# EAGLE design TLC._V_1_1_1 (EAGLE 9.6.2)
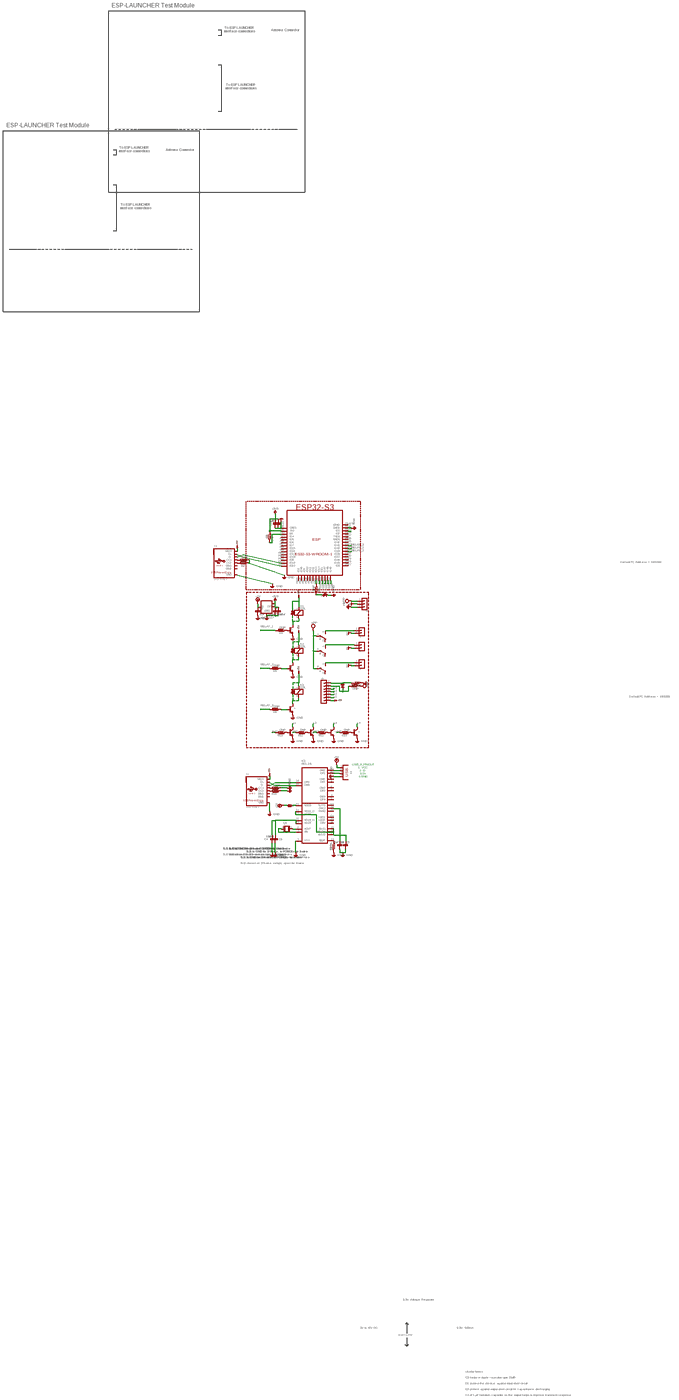
[diagram p0: schematic, sheet 1, overview]
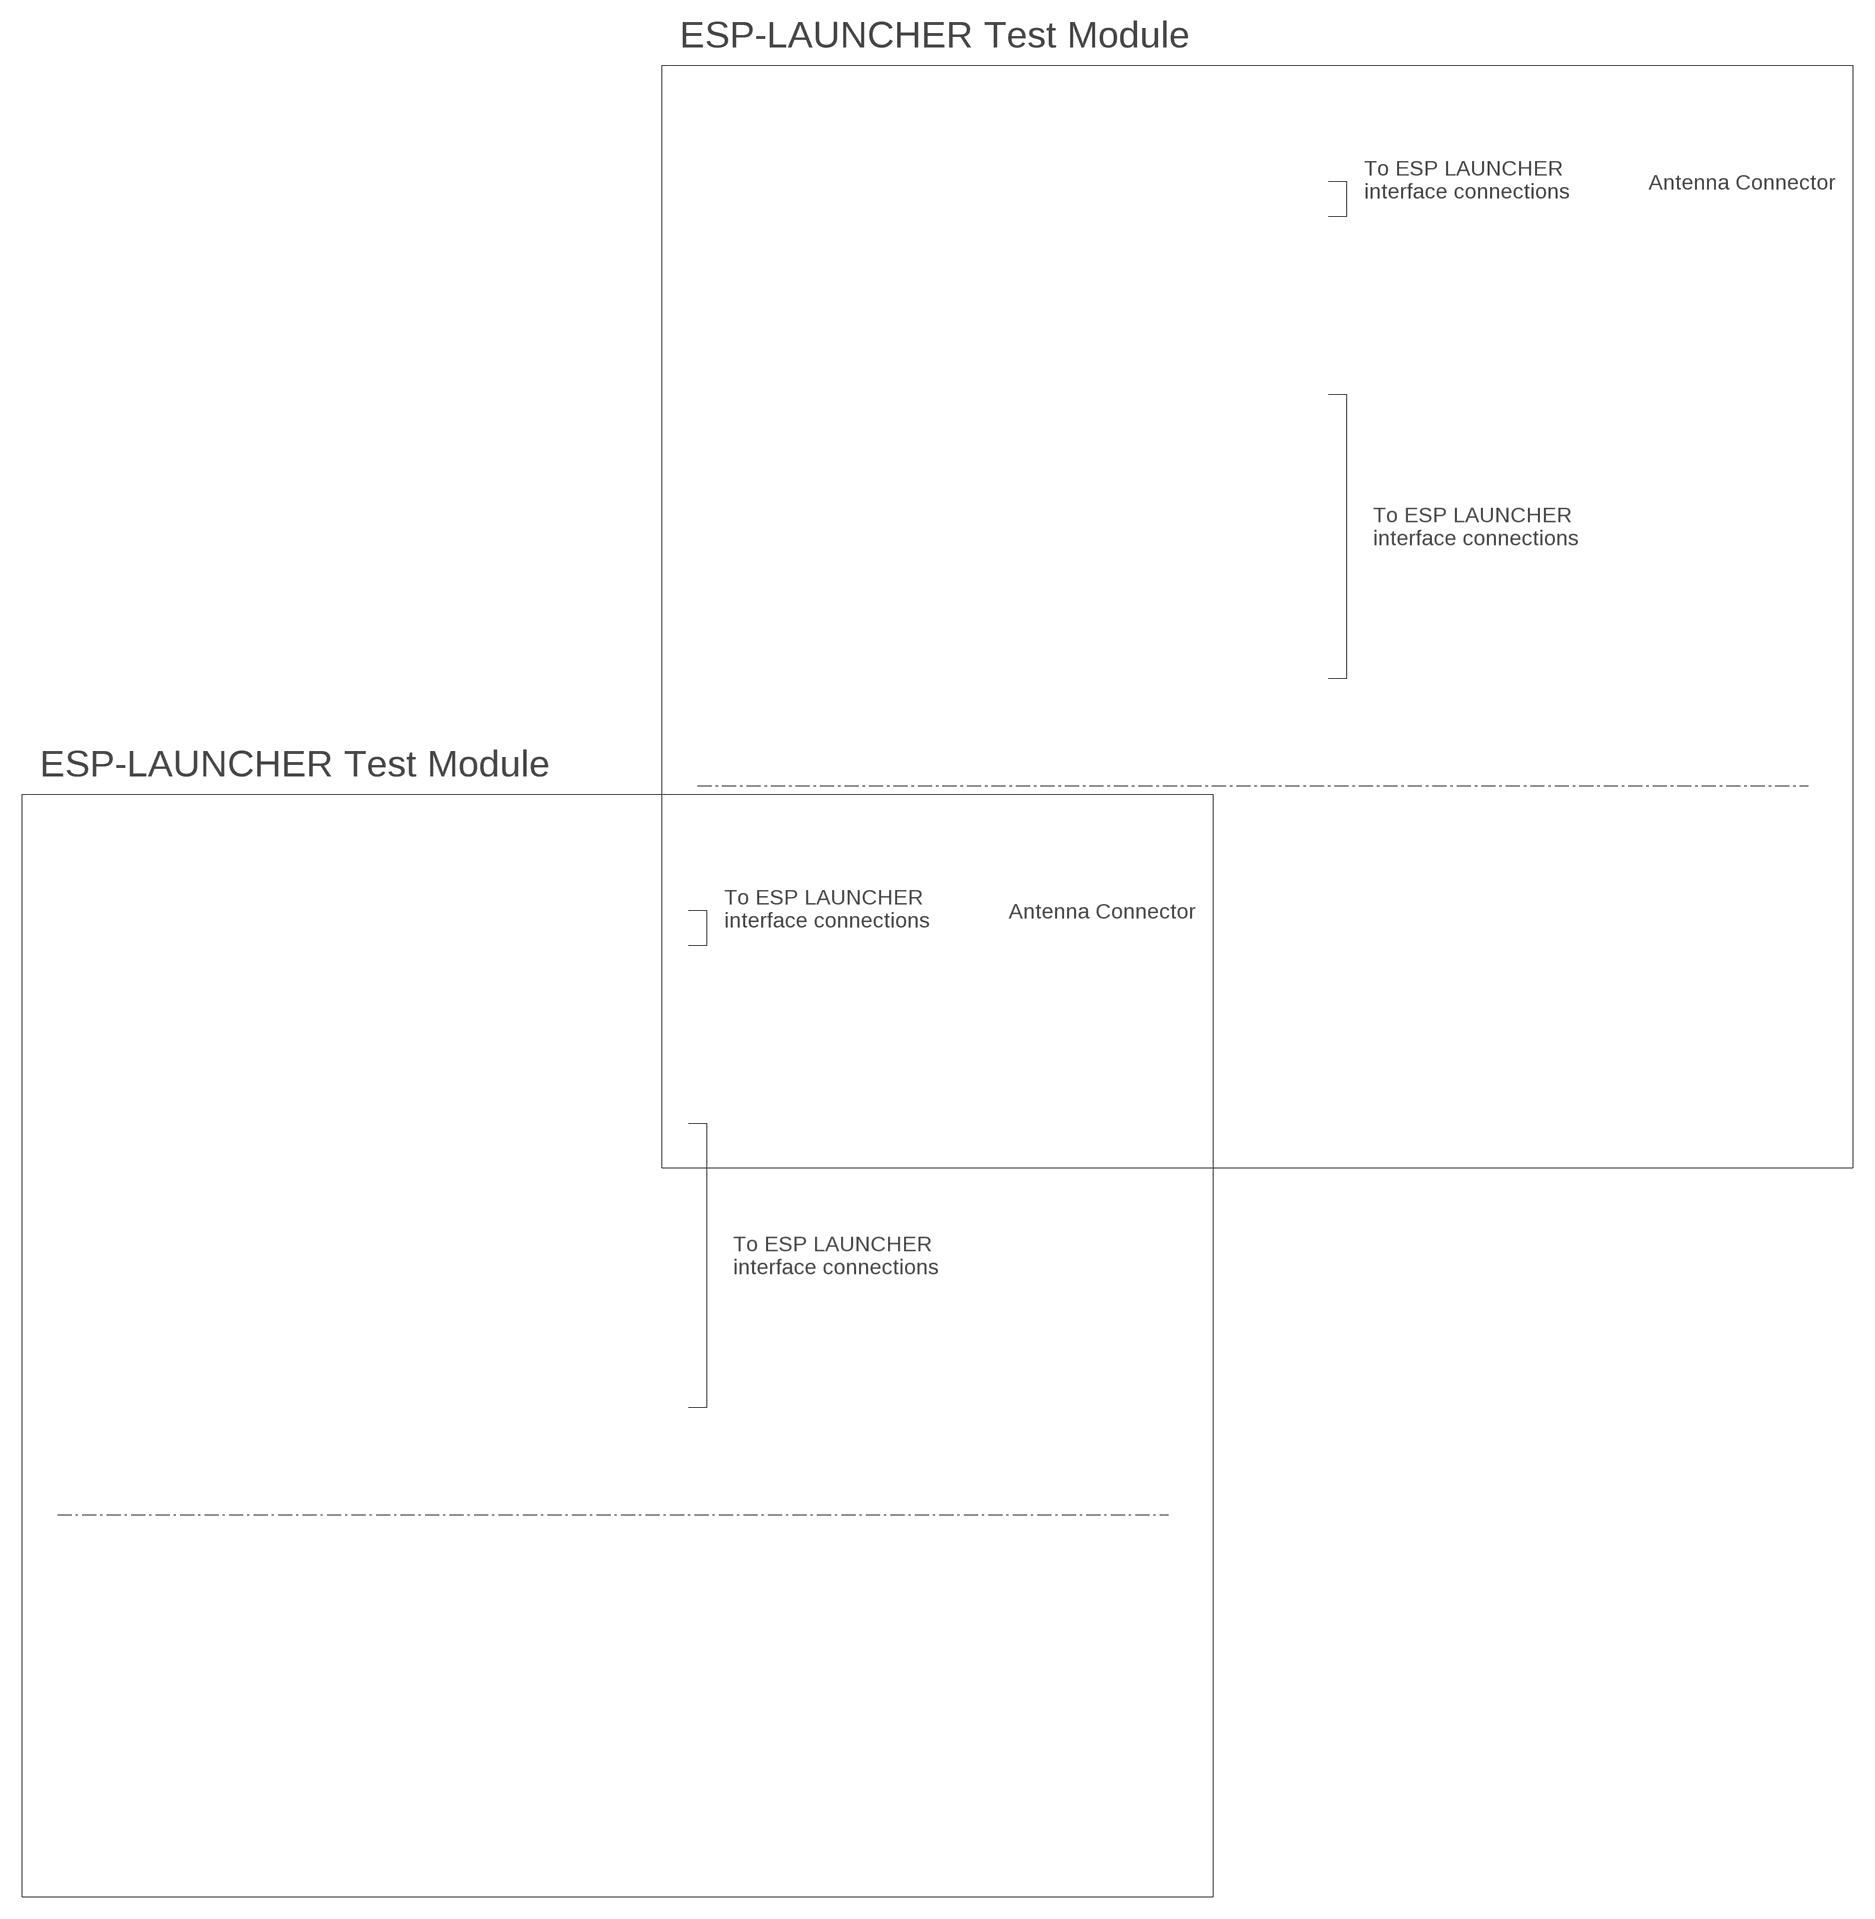
[diagram p1: schematic, sheet 1, part 1 of 4]
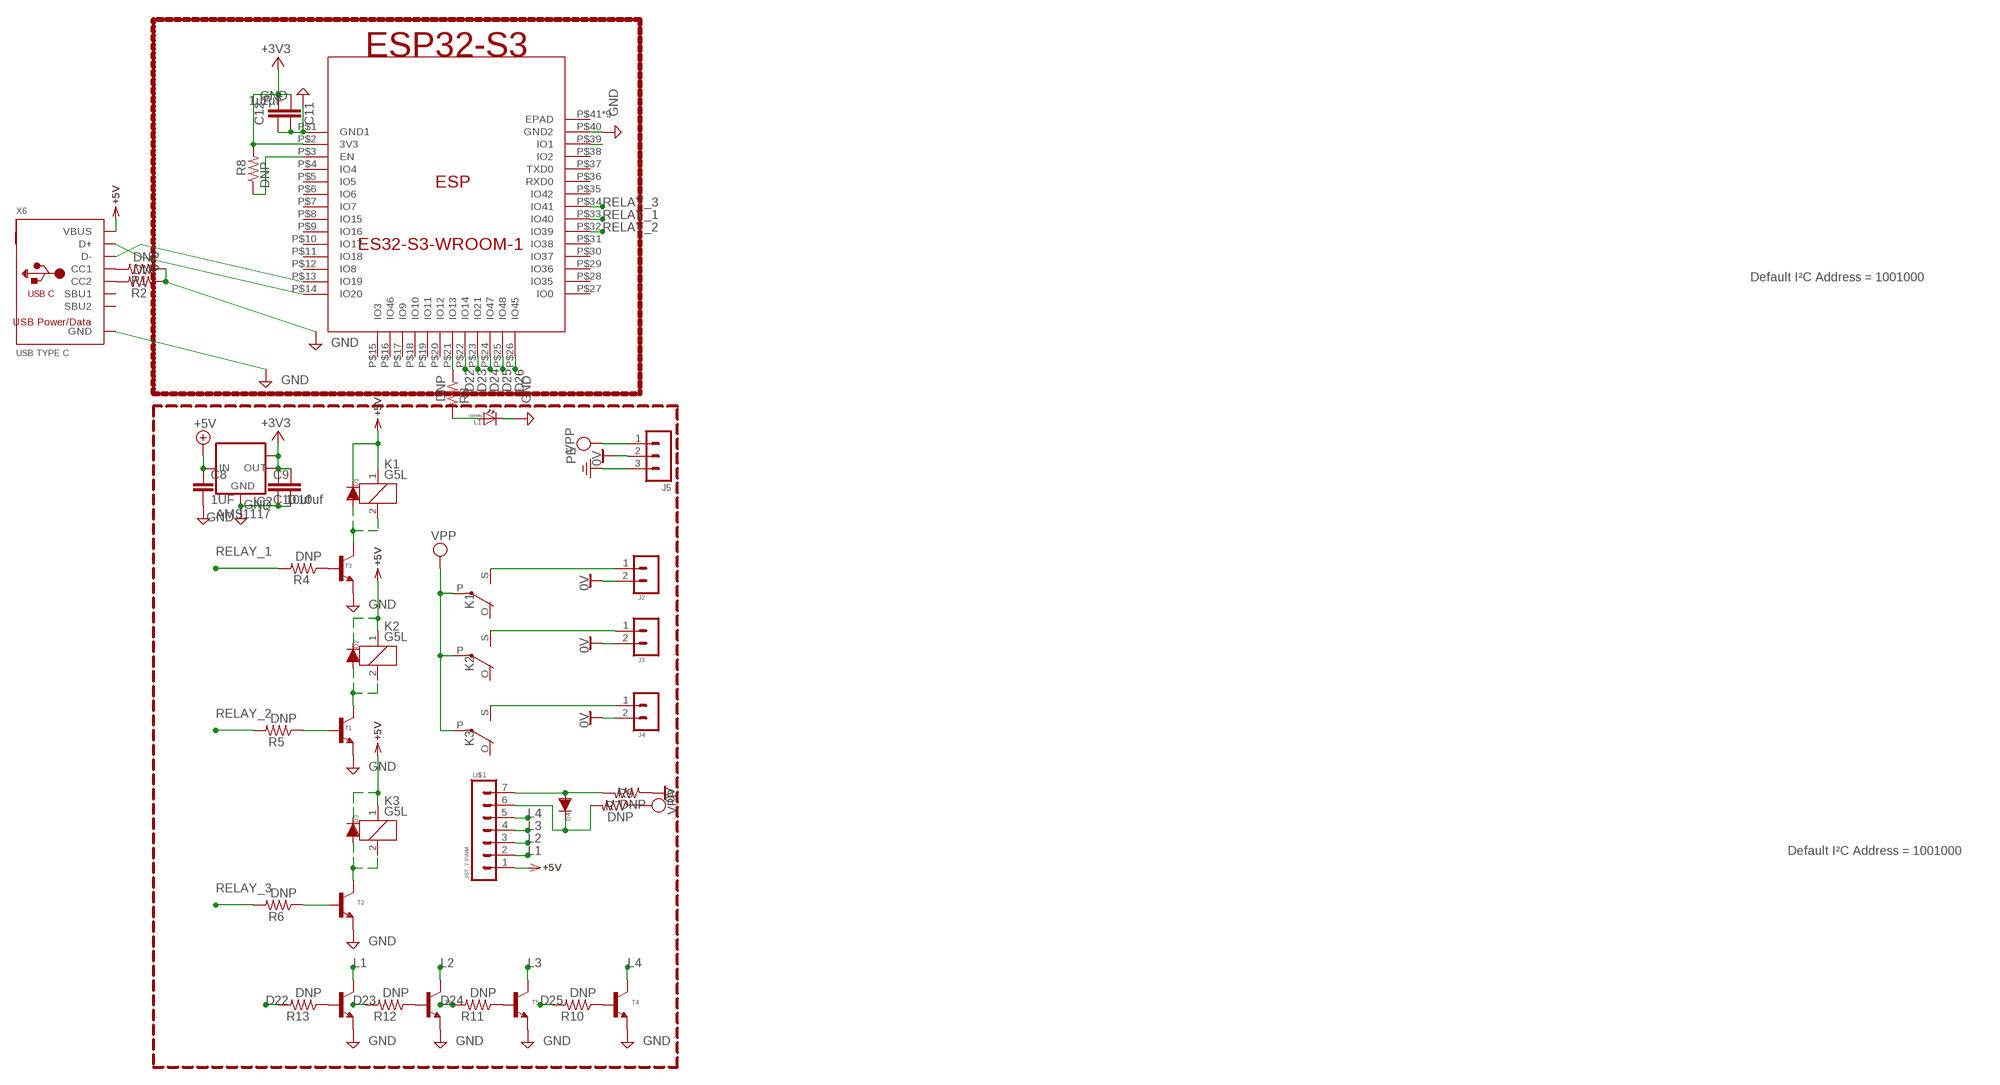
[diagram p2: schematic, sheet 1, part 2 of 4]
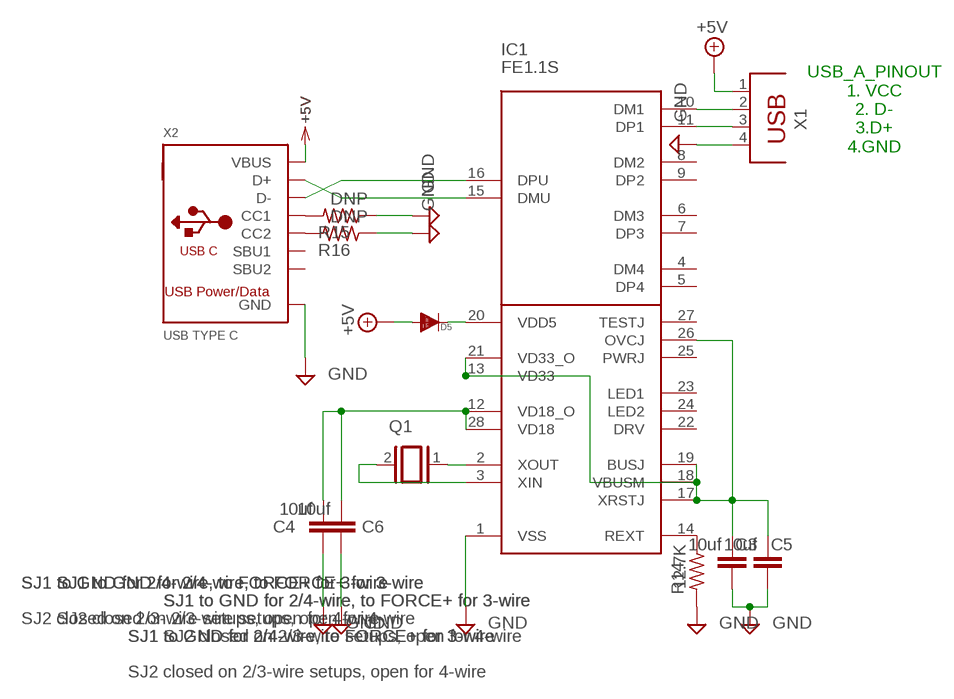
[diagram p3: schematic, sheet 1, part 3 of 4]
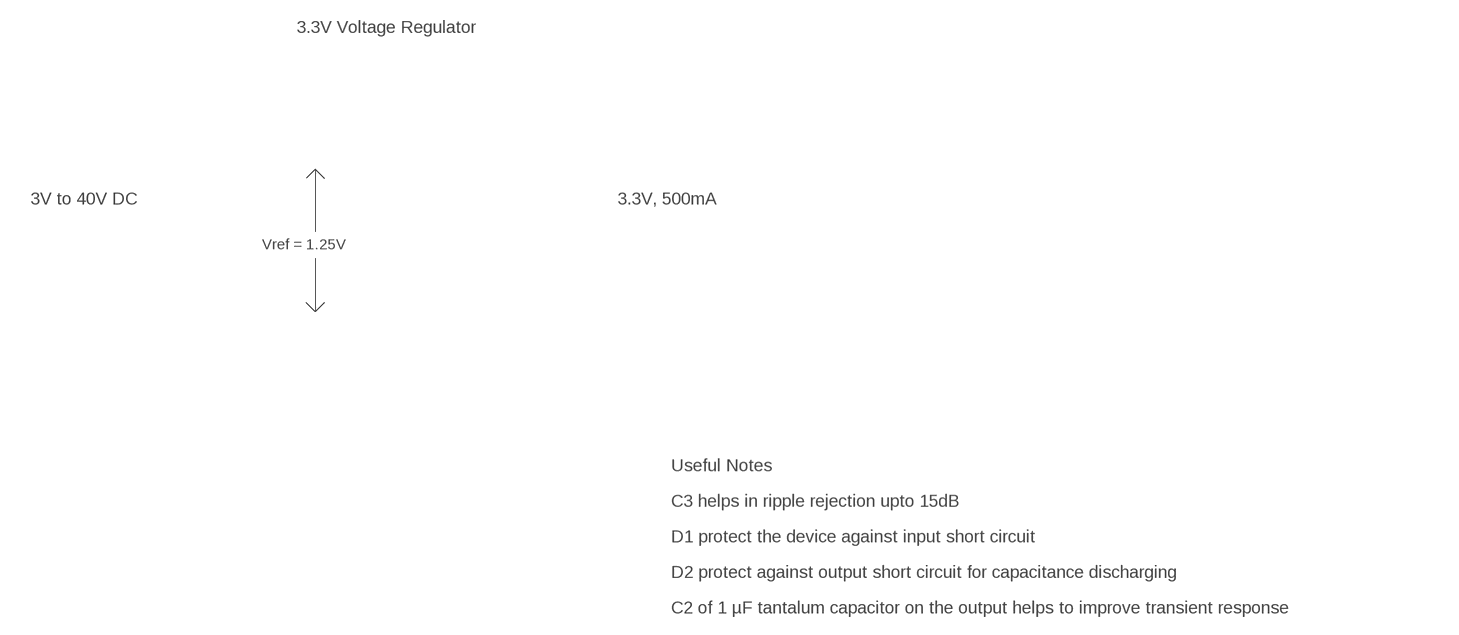
[diagram p4: schematic, sheet 1, part 4 of 4]

## Parts
C3  10uf  C-EUC1206K  [C1206K]
C4  10uf  C-EUC1206K  [C1206K]
C5  10uf  C-EUC1206K  [C1206K]
C6  10uf  C-EUC1206K  [C1206K]
C8  1UF  C-EUC1206K  [C1206K]
C9  10uf  C-EUC1206K  [C1206K]
C10  10uf  C-EUC1206K  [C1206K]
C11  1µF  C-EUC0805K  [C0805K]
C12  1µF  C-EUC0805K  [C0805K]
D1  DIODE80  [SOD-80]
D2  DIODE80  [SOD-80]
D3  DIODE80  [SOD-80]
D4  DIODE80  [SOD-80]
D5  DIODE80  [SOD-80]
ESP  ES32-S3-WROOM-1  [ESP32-S3-WROOM-1]
IC1  FE1.1S  [SOP64P600X175-28N]
IC2  AMS1117  LM1117MPX-5.0  [SOT223]
J2  JST_2-PIN_1.27MMBPT_3.5MM  [BPT-2_PIN_3.5MM]
J3  JST_2-PIN_1.27MMBPT_3.5MM  [BPT-2_PIN_3.5MM]
J4  JST_2-PIN_1.27MMBPT_3.5MM  [BPT-2_PIN_3.5MM]
J5  JST_3-PINPWR_3  [3-PIN_3.96_PWR]
K1  G5L  [G5LE]
K2  G5L  [G5LE]
K3  G5L  [G5LE]
L1  LED5MM  [LED_5MM]
Q1  XTAL/S  [QS]
R1  DNP  R-US_R0603  [R0603]
R2  DNP  R-US_R0603  [R0603]
R3  DNP  R-US_R0603  [R0603]
R4  DNP  R-US_R0603  [R0603]
R5  DNP  R-US_R0603  [R0603]
R6  DNP  R-US_R1206  [R1206]
R7  DNP  R-US_R0603  [R0603]
R8  DNP  R-US_R0603  [R0603]
R9  DNP  R-US_R0603  [R0603]
R10  DNP  R-US_R0603  [R0603]
R11  DNP  R-US_R0603  [R0603]
R12  DNP  R-US_R0603  [R0603]
R13  DNP  R-US_R0603  [R0603]
R14  12.7K  R-US_R0603  [R0603]
R15  DNP  R-US_R0603  [R0603]
R16  DNP  R-US_R0603  [R0603]
T1  TRANSISTOR_NPNSOT-23  [SOT-23]
T2  TRANSISTOR_NPNSOT-23  [SOT-23]
T3  TRANSISTOR_NPNSOT-23  [SOT-23]
T4  TRANSISTOR_NPNSOT-23  [SOT-23]
T5  TRANSISTOR_NPNSOT-23  [SOT-23]
T6  TRANSISTOR_NPNSOT-23  [SOT-23]
T7  TRANSISTOR_NPNSOT-23  [SOT-23]
U$1  JST_7-PINM  [MOLEX_7-PIN]
X1  PN87520  [PN87520]
X2  USB TYPE C  USB_C  [USB_C_CUSB31-CFM2AX-01-X]
X6  USB TYPE C  USB_C  [USB_C_CUSB31-CFM2AX-01-X]

## Nets
0V: J2.2 J3.2 J4.2 J5.2 R9.1
+3V3: C9.1 C10.1 C11.2 C12.2 ESP.P$2(3V3) IC2.2(OUT) IC2.TAB(OUT1) R8.2
+5V: C8.1 D1.K D2.K D3.K D5.A IC2.3(IN) K1.1 K2.1 K3.1 U$1.1 X1.1 X2.A4B9(VBUS) X2.B4A9(VBUS) X6.A4B9(VBUS) X6.B4A9(VBUS)
D22: ESP.P$22(IO14) R13.2
D23: ESP.P$23(IO21) R12.2
D24: ESP.P$24(IO47) R11.2
D25: ESP.P$25(IO48) R10.2
D26: ESP.P$26(IO45)
GND: C3.1 C4.1 C5.1 C6.1 C8.2 C9.2 C10.2 C11.1 C12.1 ESP.P$1(GND1) ESP.P$40(GND2) IC1.1(VSS) IC2.1(GND) L1.K R1.1 R2.1 R14.2 R15.1 R16.1 T1.2(E) T2.2(E) T3.2(E) T4.2(E) T5.2(E) T6.2(E) T7.2(E) X1.4 X2.A1B12(GND) X2.B1A12(GND) X6.A1B12(GND) X6.B1A12(GND)
L1: T7.3(C) U$1.2
L2: T6.3(C) U$1.3
L3: T5.3(C) U$1.4
L4: T4.3(C) U$1.5
N$1: R1.2 X6.A5(CC1)
N$2: R2.2 X6.B5(CC2)
N$3: ESP.P$39(IO1)
N$4: ESP.P$21(IO13) R3.1
N$5: L1.A R3.2
N$6: R5.1 T1.1(B)
N$7: D4.K R7.2 U$1.6
N$8: R4.1 T3.1(B)
N$9: J4.1 K3.S(2:S)
N$10: D1.A K1.2 T3.3(C)
N$11: D4.A R9.2 U$1.7
N$12: D2.A K2.2 T1.3(C)
N$13: R10.1 T4.1(B)
N$14: R6.1 T2.1(B)
N$15: ESP.P$3(EN) R8.1
N$16: ESP.P$13(IO19) X6.A7(D-) X6.B7(D-)
N$17: ESP.P$14(IO20) X6.A6(D+) X6.B6(D+)
N$18: D3.A K3.2 T2.3(C)
N$19: J3.1 K2.S(2:S)
N$20: J2.1 K1.S(2:S)
N$21: IC1.2(XOUT) Q1.1
N$22: R11.1 T5.1(B)
N$23: IC1.3(XIN) Q1.2
N$24: R12.1 T6.1(B)
N$25: IC1.14(REXT) R14.1
N$26: R13.1 T7.1(B)
N$27: D5.K IC1.20(VDD5)
N$28: C3.2 C5.2 IC1.13(VD33) IC1.17(XRSTJ) IC1.18(VBUSM) IC1.19(BUSJ) IC1.21(VD33_O) IC1.26(OVCJ)
N$29: IC1.10(DM1) X1.2
N$30: C4.2 C6.2 IC1.12(VD18_O) IC1.28(VD18)
N$31: IC1.11(DP1) X1.3
N$32: IC1.16(DPU) X2.A7(D-) X2.B7(D-)
N$33: IC1.15(DMU) X2.A6(D+) X2.B6(D+)
N$34: R15.2 X2.A5(CC1)
N$35: R16.2 X2.B5(CC2)
PE: J5.3
RELAY_1: ESP.P$33(IO40) R4.2
RELAY_2: ESP.P$32(IO39) R5.2
RELAY_3: ESP.P$34(IO41) R6.2
VPP: J5.1 K1.P(2:P) K2.P(2:P) K3.P(2:P) R7.1
Unconnected: ESP.P$4(IO4) ESP.P$5(IO5) ESP.P$6(IO6) ESP.P$7(IO7) ESP.P$8(IO15) ESP.P$9(IO16) ESP.P$10(IO17) ESP.P$11(IO18) ESP.P$12(IO8) ESP.P$15(IO3) ESP.P$16(IO46) ESP.P$17(IO9) ESP.P$18(IO10) ESP.P$19(IO11) ESP.P$20(IO12) ESP.P$27(IO0) ESP.P$28(IO35) ESP.P$29(IO36) ESP.P$30(IO37) ESP.P$31(IO38) ESP.P$35(IO42) ESP.P$36(RXD0) ESP.P$37(TXD0) ESP.P$38(IO2) ESP.P$41(EPAD) ESP.P$42(EPAD) ESP.P$43(EPAD) ESP.P$44(EPAD) ESP.P$45(EPAD) ESP.P$46(EPAD) ESP.P$47(EPAD) ESP.P$48(EPAD) ESP.P$49(EPAD) IC1.4(DM4) IC1.5(DP4) IC1.6(DM3) IC1.7(DP3) IC1.8(DM2) IC1.9(DP2) IC1.22(DRV) IC1.23(LED1) IC1.24(LED2) IC1.25(PWRJ) IC1.27(TESTJ) K1.O(2:O) K2.O(2:O) K3.O(2:O) X2.A8(SBU1) X2.B8(SBU2) X6.A8(SBU1) X6.B8(SBU2)

## Notes on the sheet
- ESP-LAUNCHER Test Module
- Antenna Connector
- To ESP LAUNCHER
  interface connections
- To ESP LAUNCHER
  interface connections
- ESP-LAUNCHER Test Module
- Antenna Connector
- To ESP LAUNCHER
  interface connections
- To ESP LAUNCHER
  interface connections
- Default I²C Address = 1001000
- USB Power/Data
- Default I²C Address = 1001000
- USB_A_PINOUT
  1. VCC
  2. D-
  3.D+
  4.GND
- USB Power/Data
- SJ1 to GND for 2/4-wire, to FORCE+ for 3-wire | SJ1 to GND for 2/4-wire, to FORCE+ for 3-wire | SJ1 to GND for 2/4-wire, to FORCE+ for 3-wire | SJ1 to GND for 2/4-wire, to FORCE+ for 3-wire
- SJ1 to GND for 2/4-wire, to FORCE+ for 3-wire | SJ1 to GND for 2/4-wire, to FORCE+ for 3-wire
- SJ2 closed on 2/3-wire setups, open for 4-wire | SJ2 closed on 2/3-wire setups, open for 4-wire
- SJ1 to GND for 2/4-wire, to FORCE+ for 3-wire | SJ1 to GND for 2/4-wire, to FORCE+ for 3-wire | SJ2 closed on 2/3-wire setups, open for 4-wire
- SJ2 closed on 2/3-wire setups, open for 4-wire
- 3.3V Voltage Regulator
- 3V to 40V DC | 3.3V, 500mA
- Vref = 1.25V
- Useful Notes
- C3 helps in ripple rejection upto 15dB
- D1 protect the device against input short circuit
- D2 protect against output short circuit for capacitance discharging
- C2 of 1 µF tantalum capacitor on the output helps to improve transient response

## Library data of the parts
C3-C6 C8-C12 = rcl:C-EU: CAPACITOR, European symbol; SPICEPREFIX: C
D1-D5 = Squadron:DIODE
ESP = ESP32 Module:ES32-S3-WROOM-1
IC1 = FE1.1S:FE1.1S: Check availability <https://pricing.snapeda.com/parts/FE1.1S/terminus/view-part?ref=eda>; AVAILABILITY: In Stock; CHECK_PRICES: https://www.snapeda.com/parts/FE1.1S/Terminus/view-part/?ref=eda; DESCRIPTION: USB 2.0 HIGH SPEED 4-PORT HUB CONTROLLER; MF: terminus; MP: FE1.1S; PACKAGE: None; PRICE: None; SNAPEDA_LINK: https://www.snapeda.com/parts/FE1.1S/Terminus/view-part/?ref=snap
IC2 = lm1117:LM1117MPX-*
J2-J4 = Squadron:JST_2-PIN_1.27MM
J5 = Squadron:JST_3-PIN
K1-K3 = relay:G5L: RELAY 1 x switch, 10 A/120 V AC, 8 A/30 V ADC, Omron
L1 = Squadron:LED
Q1 = special:XTAL/S: CRYSTAL
R1-R16 = rcl:R-US_: RESISTOR, American symbol; SPICEPREFIX: R
T1-T7 = Squadron:TRANSISTOR_NPN
U$1 = Squadron:JST_7-PIN
X1 = con-berg:PN87520: BERG USB connector; OC_FARNELL: unknown; OC_NEWARK: unknown
X2 X6 = adafruit_electromech:USB_C: USB Type-C USB 2.0 Connector

## Module WAVESHAREDISPLAY
Ports: 

### Library data of the parts

## Board
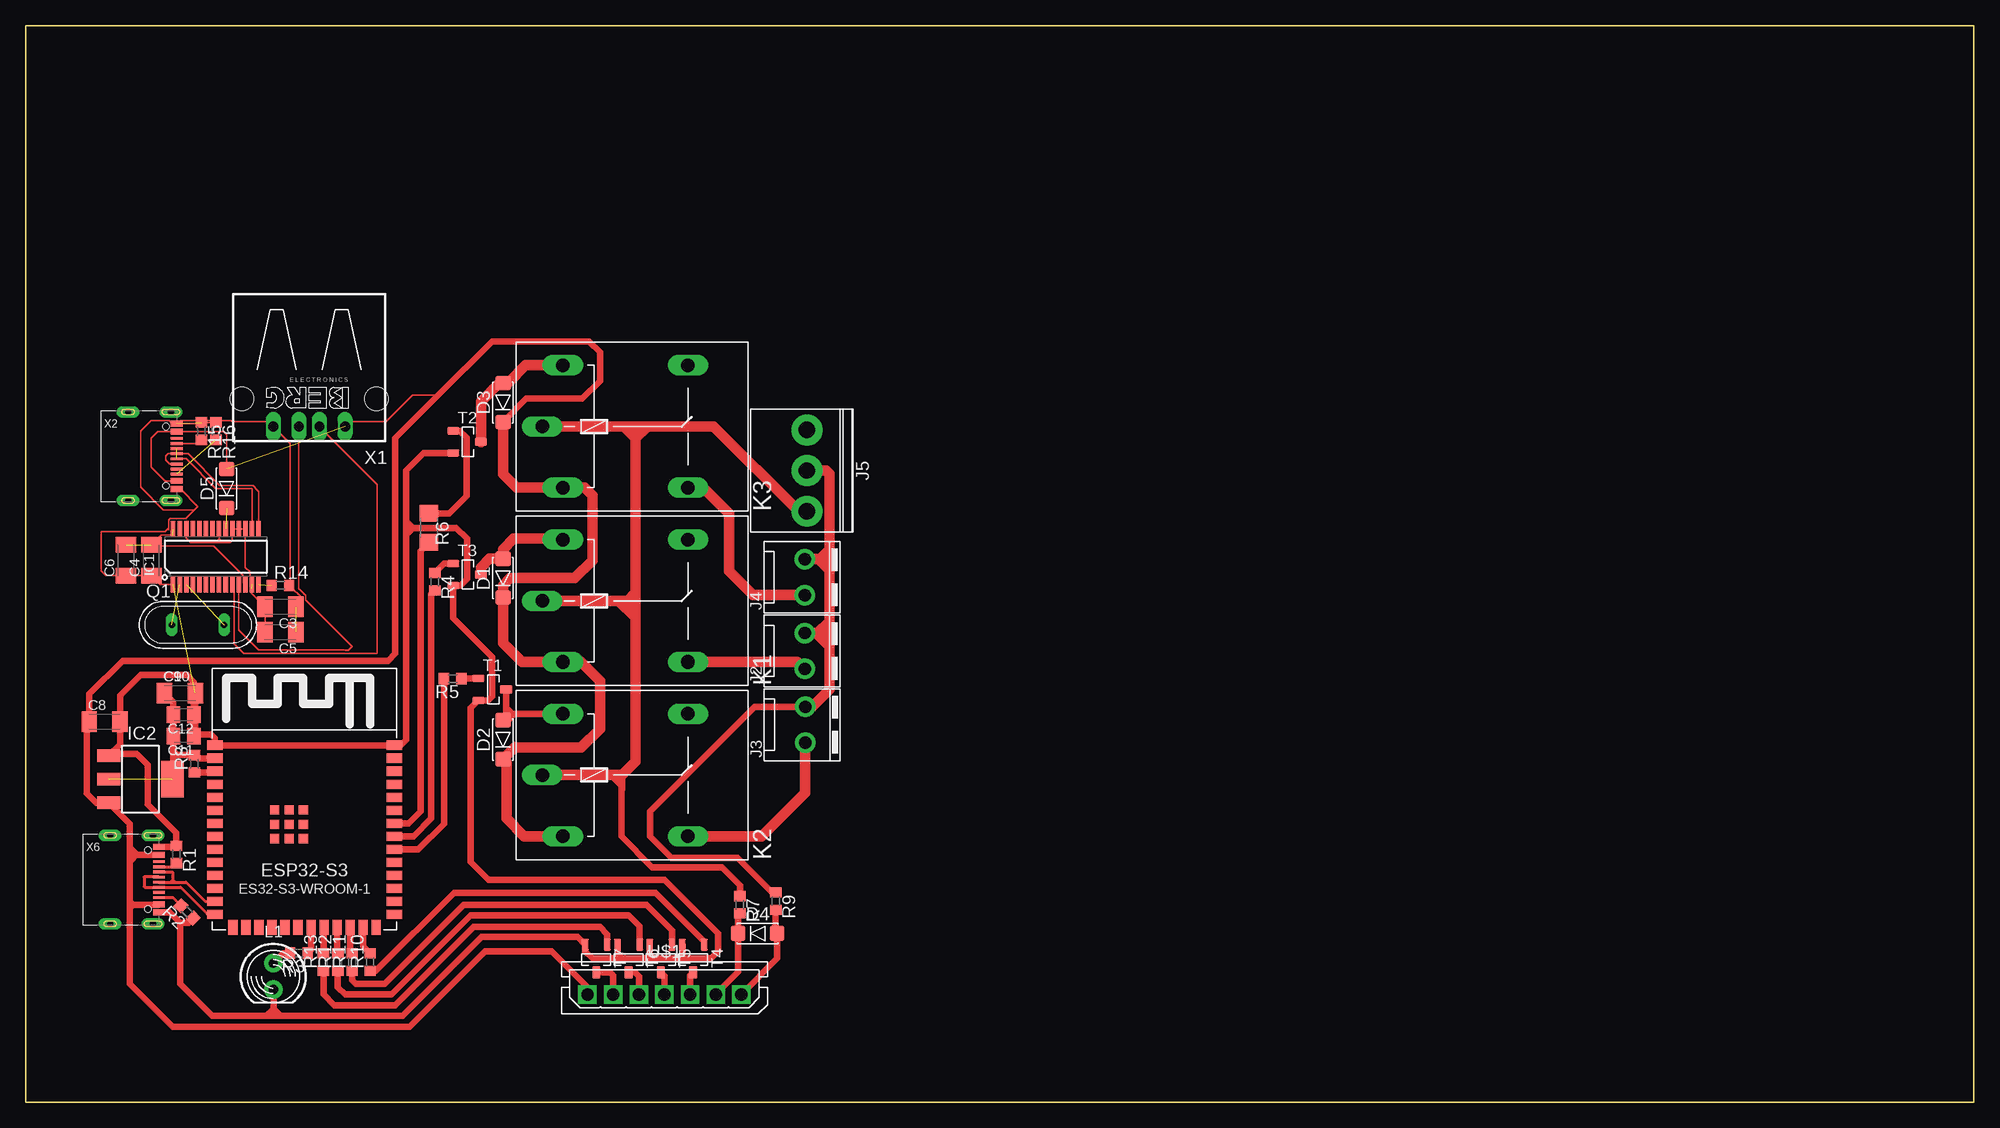
[diagram p5: board, top side]

Size 190 x 105 mm. Coordinates in mm from the lower left corner, seen from the top.
Outline: 0,0 190,0 190,105 0,105 0,0
Copper layers (1*16): Top 0.035mm / dielectric 1.5mm / Bottom 0.035mm
Design rules "default": minimum track width 6mil, minimum drill 0.35mm, track to track 6mil, track to pad 6mil, pad to pad 6mil, via to via 6mil, smd to smd 6mil, copper to edge 40mil, drill to drill 6mil, minimum pad ring 10mil, minimum via ring 8mil, stop-mask expansion 4mil, vias tented up to drill 0mil, thermal gap 10mil

### Footprints (pad centres in the part's own frame; a part is rotated, then mirrored left to right if it is on the bottom)
C1206K = smd 1.5 x 2: 1 -1.5,0; 2 1.5,0
C0805K = smd 1.3 x 1.6: 1 -1,0; 2 1,0
SOD-80 = smd 1.4 x 1.5: A -1.9,0; K 1.9,0
ESP32-S3-WROOM-1 = smd 1.5 x 0.9: P$1 0.25,18.01; P$2 0.25,16.74; P$3 0.25,15.47; P$4 0.25,14.2; P$5 0.25,12.93; P$6 0.25,11.66; P$7 0.25,10.39; P$8 0.25,9.12; P$9 0.25,7.85; P$10 0.25,6.58; P$11 0.25,5.31; P$12 0.25,4.04; P$13 0.25,2.77; P$14 0.25,1.5; P$27 17.75,1.5; P$28 17.75,2.77; P$29 17.75,4.04; P$30 17.75,5.31; P$31 17.75,6.58; P$32 17.75,7.85; P$33 17.75,9.12; P$34 17.75,10.39; P$35 17.75,11.66; P$36 17.75,12.93; P$37 17.75,14.2; P$38 17.75,15.47; P$39 17.75,16.74; P$40 17.75,18.01 | smd 0.9 x 1.5: P$15 2.015,0.25; P$16 3.285,0.25; P$17 4.555,0.25; P$18 5.825,0.25; P$19 7.095,0.25; P$20 8.365,0.25; P$21 9.635,0.25; P$22 10.905,0.25; P$23 12.175,0.25; P$24 13.445,0.25; P$25 14.715,0.25; P$26 15.985,0.25 | smd 0.9 x 0.9: P$41 6.1,11.69; P$42 7.5,11.69; P$43 8.9,11.69; P$44 6.1,10.29; P$45 7.5,10.29; P$46 8.9,10.29; P$47 6.1,8.89; P$48 7.5,8.89; P$49 8.9,8.89
SOP64P600X175-28N = smd 0.44 x 1.525: 1 -4.16,-2.712; 2 -3.52,-2.712; 3 -2.88,-2.712; 4 -2.24,-2.712; 5 -1.6,-2.712; 6 -0.96,-2.712; 7 -0.32,-2.712; 8 0.32,-2.712; 9 0.96,-2.712; 10 1.6,-2.712; 11 2.24,-2.712; 12 2.88,-2.712; 13 3.52,-2.712; 14 4.16,-2.712; 15 4.16,2.712; 16 3.52,2.712; 17 2.88,2.712; 18 2.24,2.712; 19 1.6,2.712; 20 0.96,2.712; 21 0.32,2.712; 22 -0.32,2.712; 23 -0.96,2.712; 24 -1.6,2.712; 25 -2.24,2.712; 26 -2.88,2.712; 27 -3.52,2.712; 28 -4.16,2.712
SOT223 = smd 1.219 x 2.235: 1 -2.311,-3.099; 2 0,-3.099; 3 2.311,-3.099 | smd 3.6 x 2.2: TAB 0,3.099
BPT-2_PIN_3.5MM = drill 1.2 pad 2: 1 -1.75,0; 2 1.75,0
3-PIN_3.96_PWR = drill 1.6 pad 3: 1 3.96,5.5; 2 0,5.5; 3 -3.96,5.5
G5LE = drill 1.321 long: 1 -7.493,-5.969; 2 -7.493,5.969; O 4.699,5.969; P -9.525,0; S 4.699,-5.969
LED_5MM = drill 0.9 pad 1.8: A 0,-1.295; K -0.025,1.27
QS = drill 0.61 long: 1 -2.54,0; 2 2.54,0
R0603 = smd 1 x 1.1: 1 -0.85,0; 2 0.85,0
R1206 = smd 1.6 x 1.803: 1 -1.422,0; 2 1.422,0
SOT-23 = smd 0.7 x 1.2: 1 -1.077,-1.35; 2 1.077,-1.35 | smd 0.8 x 1.2: 3 0,1.35
MOLEX_7-PIN = drill 1.2 pad 1.75 square: 1 7.5,0; 2 5,0; 3 2.5,0; 4 0,0; 5 -2.5,0; 6 -5,0; 7 -7.5,0
PN87520 = drill 0.95 long: 1 -3.5,2.71; 2 -1,2.71; 3 1,2.71; 4 3.5,2.71 | hole 2.3: -6.57,0; 6.57,0
USB_C_CUSB31-CFM2AX-01-X = smd 0.575 x 1.15: A1B12 -3.2,3.545; A4B9 -2.4,3.545; B1A12 3.2,3.545; B4A9 2.4,3.545 | smd 0.275 x 1.15: A5 -1.25,3.545; A6 -0.25,3.545; A7 0.25,3.545; A8 1.25,3.545; B5 1.75,3.545; B6 0.75,3.545; B7 -0.75,3.545; B8 -1.75,3.545 | drill 0.6 pad 1 long: M1 -4.32,2.97; M2 4.32,2.97; M3 -4.32,-1.21; M4 4.32,-1.21 | hole 0.65: 2.89,2.47; -2.89,2.47

### Placement (x,y rotation side)
C3  24.85,48.3 180 top
C4  12.25,52.85 90 top
C5  24.85,45.85 180 top
C6  9.8,52.85 90 top
C8  7.7,37.1 0 top
C9  15.05,39.9 0 top
C10  15.05,39.9 0 top
C11  15.4,35.7 180 top
C12  15.4,37.8 180 top
D1  46.55,51.1 270 top
D2  46.55,35.35 270 top
D3  46.55,68.25 270 top
D4  71.4,16.45 180 top
D5  19.6,59.85 270 top
ESP  18.2,16.8 0 top
IC1  18.55,53.2 0 top
IC2  11.2,31.5 270 top
J2  76,44 90 top
J3  76.03,36.8 90 top
J4  76,51.2 90 top
J5  70.7,61.6 270 top
K1  59.9,48.9 0 top
K2  59.9,31.9 0 top
K3  59.9,65.9 0 top
L1  24.15,12.25 180 top
Q1  16.8,46.55 0 top
R1  14.7,24.15 270 top
R2  15.75,18.55 135 top
R3  26.65,14.53 180 top
R4  39.9,50.75 270 top
R5  41.65,41.3 180 top
R6  39.35,56.02 270 top
R7  69.65,19.25 270 top
R8  16.45,33 90 top
R9  73.15,19.6 270 top
R10  33.6,13.65 90 top
R11  31.85,13.65 90 top
R12  30.45,13.65 90 top
R13  29.05,13.65 90 top
R14  24.85,50.4 0 top
R15  17.15,65.45 270 top
R16  18.55,65.45 270 top
T1  45.5,40.25 270 top
T2  43.05,64.4 270 top
T3  43.05,51.45 270 top
T4  65.1,14 180 top
T5  61.95,14 180 top
T6  58.8,14 180 top
T7  55.65,14 180 top
U$1  62.3,10.5 180 top
X1  27.65,68.6 180 top
X2  11.2,63 270 top
X6  9.45,21.7 270 top

### Tracks (layer width: path | path; a pad name or v marks a point on that pad's centre or on a via)
0V
  Top 0.61: R9.1 72.8,20.45 69.45,23.8 63,23.8 60.9,25.9 60.9,28.35 71.1,38.55 J3.2
  Top 1.016: J3.2 76.7,38.55 78.4,40.25 78.4,44.45 | 77.1,45.75 78.4,44.45 | 77.1,45.75 J2.2 77.95,45.75 78.4,46.2 | 78.4,44.45 78.4,46.2 | 78.4,46.2 78.4,46.9 | 78.4,46.9 78.4,51.9 | 78.4,51.9 78.4,52.5 | 77.45,52.95 77.95,52.95 78.4,52.5 | J4.2 77.35,52.95 | J5.2 78.05,61.6 78.4,61.25 78.4,53.9 | 78.4,53.9 78.4,52.5 | 77.35,52.95 77.45,52.95 | 77.45,52.95 78.4,53.9 | 77.35,52.95 78.4,51.9 | 77.1,45.75 77.25,45.75 78.4,46.9
+3V3  (1 unrouted)
  Top 0.61: IC2.TAB 14.35,31.5 14.7,31.15 14.65,31.15 IC2.TAB | IC2.TAB 14.4,31.6 14.4,34.25 | 14.4,34.25 C11.2 C12.2 14.4,39.05 C10.1 | 14.4,34.25 14.8,33.85 R8.2 16.76,33.54 ESP.P$2
+5V  (1 unrouted)
  Top 0.152: D5.A 19.6,65.1 19.3,65.4 X2.A4B9 12.9,65.4 12.25,64.75 12.25,61.95 13.6,60.6 X2.B4A9 | X1.1 31.62,66.36 35.15,66.36 37.74,68.95 40.25,68.95
  Top 0.61: 47.75,34.65 47.67,34.58 46.8,33.7 D2.K | 10.44,23.74 10.15,23.45 | 10.32,23.62 10.8,24.1 | 10.8,24.1 X6.A4B9 | D3.K 48.8,68.6 54.25,68.6 56,70.35 56,73.15 54.95,74.2 45.5,74.2 40.25,68.95 36.05,64.75 36.05,43.75 35.35,43.05 9.45,43.05 6.2,39.8 C8.1 5.95,36.85 5.95,30.1 6.86,29.19 IC2.3 | U$1.1 54.8,11.2 51.3,14.7 44.8,14.7 37.45,7.35 14.35,7.35 10.15,11.55 10.15,18.9 | 10.15,23.45 10.15,19.6 | 10.15,19.6 10.15,19.25 | 10.15,19.25 10.15,18.9 | X6.B4A9 12.95,19.25 10.5,19.25 | 10.15,19.25 10.5,19.25 | 10.5,19.25 10.15,19.6 | 10.5,19.25 10.15,18.9 | 10.15,23.45 10.15,24.85 | 10.8,24.1 10.8,24.2 10.15,24.85 | IC2.3 7.96,29.05 | IC2.3 10.15,27.14 10.15,24.85
  Top 1.016: K2.1 48.62,25.93 46.9,27.65 46.9,33.1 D2.K | D3.K 46.55,61.25 47.87,59.93 K3.1 54.52,59.93 55.3,59.15 55.3,52.85 53.55,51.1 47.25,51.1 46.55,50.4 D1.K 46.55,44.8 48.42,42.93 K1.1 54.16,42.93 56,41.09 56,36.4 54.17,34.58 47.67,34.58 | 47.75,34.65 46.8,33.7
D22
  Top 0.61: R13.2 29.05,17 ESP.P$22
D23
  Top 0.61: ESP.P$23 30.38,14.57 R12.2
D24
  Top 0.61: R11.2 31.64,14.71 ESP.P$24
D25
  Top 0.61: ESP.P$25 32.91,15.19 R10.2
GND  (3 unrouted)
  Top 0.152: R14.2 25.8,50.3 | 25.8,50.3 26.95,49.15 26.95,47.95 26.7,47.95 C3.1 | R16.1 R15.1 17.05,66.2 15.09,66.2 15.09,66.5 20.01,66.5 20.15,66.36 23.68,66.36 X1.4 25.8,64.24 25.8,50.3 | IC1.1 13.11,50.49 C4.1 C6.1 7.8,51.35 7.35,51.8 7.35,55.65 13.59,55.65 13.94,56 | X2.B1A12 15.1,59.8 16.8,58.1 16.45,57.75 | 16.45,57.75 15.6,56.9 14.07,56.9 13.94,56.77 13.94,56 | 13.94,56 13.94,55.83 | X2.A1B12 14.29,66.2 13.99,66.5 12.25,66.5 11.2,65.45 11.2,59.99 13.44,57.75 16.45,57.75
  Top 0.305: R1.1 13.51,25 13.41,24.9
  Top 0.61: T2.2 38.82,63.32 37.1,61.6 37.1,56.7 | 37.1,56.7 37.1,56 | 37.1,56 37.1,55.3 | 37.1,55.3 37.1,35.35 36.56,34.81 ESP.P$40 ESP.P$1 18.45,35.51 18.1,35.86 16.56,35.86 C11.1 16.4,36.05 | 63.7,14 64.05,14.35 64.05,15.32 T4.2 | 57.4,14 55.3,14 54.57,14.73 T7.2 53.82,16.1 44.45,16.1 36.75,8.4 24.85,8.4 | 57.4,14 57.75,14 | 57.75,14 58.1,14 | 58.1,14 60.55,14 | 60.55,14 60.9,14 | 60.9,14 61.25,14 | 61.25,14 63.7,14 | 60.87,14.32 60.87,14.03 60.9,14 | T5.2 60.87,14.35 | 60.87,14.35 60.87,14.32 | 60.87,14.32 60.55,14 | 60.87,14.35 60.9,14.35 61.25,14 | T6.2 57.75,15.32 57.75,14.35 | 57.75,14.35 57.75,14 | 57.75,14.35 57.4,14 | 57.75,14.35 58.1,14 | X6.B1A12 14.05,18.5 15.05,17.5 | 24.15,8.4 24.85,8.4 | X6.A1B12 14.6,24.9 R1.1 14.7,26.25 11.9,29.05 11.9,32.9 10.85,33.95 8.1,33.95 IC2.1 9.2,34.91 C8.2 9.2,39.65 11.2,41.65 15.75,41.65 16.4,41 C12.1 16.4,36.4 | 37.8,56 42,56 43.05,54.95 43.05,51.02 42.4,50.37 T3.2 41.7,47.2 45.5,43.4 45.5,39.55 45.12,39.17 T1.2 43.4,38.42 43.4,23.45 45.15,21.7 62.3,21.7 67.55,16.45 67.55,14.7 66.85,14 63.7,14 | 37.1,56 37.8,56 | 37.1,56.7 37.8,56 | 37.8,56 37.1,55.3 | 16.4,36.4 16.4,36.05 | 16.4,36.05 16.55,36.2 C10.2 16.55,36.55 16.4,36.4 | 15.05,17.5 15.9,17.5 R2.1 | 15.05,17.5 15.05,11.55 18.2,8.4 23.48,8.4 | 23.48,8.4 24.15,8.4 | L1.K 24.18,9.1 | 24.18,9.1 24.18,8.43 24.15,8.4 | 24.18,9.1 23.48,8.4 | 24.18,9.1 24.85,8.43 24.85,8.4
L1
  Top 0.61: T7.3 57,12.65 57.3,12.35 U$1.2
L2
  Top 0.61: T6.3 59.45,12.65 59.85,12.25 59.85,10.55 U$1.3
L3
  Top 0.61: T5.3 62.3,12.3 U$1.4
L4
  Top 0.61: T4.3 64.8,12.35 U$1.5
N$1
  Top 0.305: X6.A5 14.35,22.95 R1.2
N$2
  Top 0.305: X6.B5 14.35,19.95 R2.2
N$4
  Top 0.61: R3.1 27.85,14.88 27.85,17.04 ESP.P$21
N$5
  Top 0.61: L1.A 25.14,14.53 R3.2
N$6
  Top 0.61: T1.1 44.12,41.3 R5.1
N$7
  Top 0.61: R7.2 69.5,18.25 D4.K 69.5,12.7 U$1.6
N$8
  Top 0.61: R4.1 40.83,52.53 T3.1
N$9
  Top 1.016: K3.S 66.07,59.93 68.6,57.4 68.6,51.8 70.95,49.45 J4.1
N$10
  Top 1.016: K1.2 52.33,54.95 47.6,54.95 46.55,53.9 D1.A 45.25,53 44.4,52.15 T3.3
N$11
  Top 0.61: R9.2 73.15,16.6 D4.A 73.3,14 U$1.7
N$12
  Top 0.61: 46.85,37.55 46.85,38.5 | 46.85,38.5 T1.3 | 46.85,37.55 47.17,37.87 47.48,37.87 | K2.2 47.6,37.87 | 47.6,37.87 47.48,37.87 | 47.48,37.87 46.85,38.5 | 47.6,37.87 47.6,37.8 46.9,37.1 46.7,37.1 D2.A 46.85,37.55
N$13
  Top 0.61: T4.1 66.18,15.7 61.45,20.43 41.78,20.43 34.15,12.8 R10.1
N$14
  Top 0.61: T2.1 42.32,65.48 42.99,64.81 42.99,59.09 41.3,57.4 39.39,57.4 R6.1
N$15
  Top 0.61: ESP.P$3 18.33,32.15 R8.1
N$16
  Top 0.305: X6.A7 14.1,21.45 | 14.1,21.45 14.35,21.45 | 14.35,21.45 14.6,21.45 | 14.6,21.45 15.65,21.45 17.53,19.57 ESP.P$13 | X6.B7 14.3,22.45 14.35,22.4 14.35,21.7 | 14.35,21.45 14.35,21.7 | 14.35,21.7 14.1,21.45 | 14.35,21.7 14.6,21.45
N$17
  Top 0.305: ESP.P$14 17.75,18.3 15.1,20.95 X6.B6 11.6,20.95 11.55,21 11.55,21.95 X6.A6
N$18
  Top 1.016: T2.3 44.4,68.35 46.2,70.15 D3.A 47.05,70.15 48.77,71.87 K3.2
N$19
  Top 1.016: K2.S 71.78,25.93 76.03,30.18 J3.1
N$20
  Top 1.016: J2.1 75.22,42.93 K1.S
N$21  (1 unrouted)
N$22
  Top 0.61: R11.1 31.85,11.9 32.2,11.55 35,11.55 42.7,19.25 60.55,19.25 63.03,16.77 T5.1
N$23  (1 unrouted)
N$24
  Top 0.61: 30.59,12.66 R12.1 30.45,11.2 31.15,10.5 35.7,10.5 43.4,18.2 58.8,18.2 59.88,17.12 T6.1
N$25  (1 unrouted)
N$26
  Top 0.61: 56.73,15.72 T7.1 56.73,16.36 56,17.09 43.69,17.09 36.05,9.45 30.1,9.45 29.05,10.5 R13.1
N$27  (1 unrouted)
N$28  (1 unrouted)
  Top 0.152: IC1.13 21.88,50.68 21.88,51.7 21.43,52.14 IC1.17 IC1.18 IC1.19 20.15,54.8 19.95,54.6 19.19,54.6 | 19.19,54.6 18.9,54.6 | 18.9,54.6 18.87,54.63 | IC1.21 18.87,54.92 | 18.87,54.92 18.87,54.63 | IC1.26 15.67,55.03 16.1,54.6 18.55,54.6 | 18.84,54.6 18.9,54.6 | 18.87,54.63 18.84,54.6 | 18.84,54.6 18.55,54.6 | 18.55,54.6 18.87,54.92 | 18.87,54.92 19.19,54.6 | C5.2 C3.2 22.05,49.6 22.05,50.05
N$29
  Top 0.152: IC1.10 20.34,50.3 20.34,44.69 21.28,43.75 34.3,43.75 34.3,60.24 X1.2
N$30  (2 unrouted)
  Top 0.152: IC1.12 21.24,50.68 21.24,51.34 18.33,54.25 12.95,54.25 12.95,54.6 12.5,54.6 C4.2 13.2,55.3 14.35,55.3
N$31
  Top 0.152: X1.3 26.65,50.07 27.33,49.4 27.33,48.97 31.85,44.45 31.68,44.27 31.5,44.1 | 31.5,44.1 31.45,44.05 31.15,44.05 | IC1.11 20.79,46.06 22.75,44.1 31.5,44.1
N$32  (1 unrouted)
  Top 0.152: IC1.16 22.07,59.83 22.05,59.85 19.25,59.85 19.18,59.85 18.55,59.85 15.65,62.75 X2.A7
N$33
  Top 0.152: IC1.15 22.71,59.54 22.38,59.88 22.38,59.96 22.18,60.16 18.95,60.16 15.85,63.25 X2.A6 13.9,63.25 13.65,63 13.65,62.65 14.05,62.25 X2.B6
N$34
  Top 0.152: R15.2 16.8,64.25 X2.A5
N$35  (1 unrouted)
RELAY_1
  Top 0.61: ESP.P$33 37.82,25.92 39.55,27.65 39.55,49.55 R4.2
RELAY_2
  Top 0.61: R5.2 40.8,27.15 38.3,24.65 ESP.P$32
RELAY_3
  Top 0.61: R6.2 38.5,53.75 38.5,28.35 37.34,27.19 ESP.P$34
VPP
  Top 0.61: R7.1 69.65,21.15 67.9,22.9 61.1,22.9 58.1,25.9 58.1,30.45 | 58.1,30.45 58.1,30.85 57.05,31.9 | 55.7,31.9 55.95,31.9 | 58.1,30.45 58.15,30.5 58.15,31.9
  Top 1.016: K2.P 55.7,31.9 57.05,31.9 58.15,31.9 59.5,33.25 59.5,47.25 | 59.5,64.75 59.5,49.7 | 59.5,49.7 59.5,47.25 | 59.5,49.7 58.7,48.9 K1.P 57.85,48.9 59.5,47.25 | K3.P 58.35,65.9 | 58.35,65.9 58.55,65.9 60.55,65.9 | 58.35,65.9 59.5,64.75 | J5.1 75.36,57.64 67.1,65.9 60.55,65.9 | 59.5,64.75 60.55,65.8 60.55,65.9